# Altium schematic sheet micro_sd.SchDoc
size A3; SheetNumber: 12; SheetTotal: 15
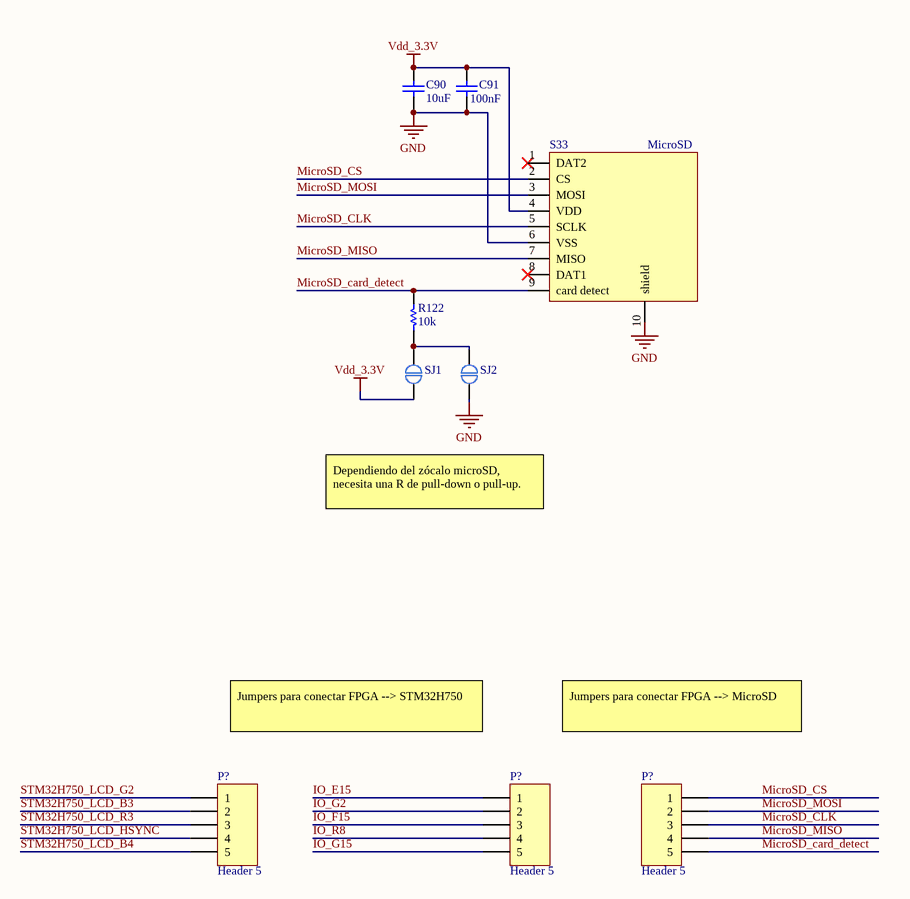
[diagram p0: micro_sd.SchDoc]

## Parts
(Parts that share a designator on the sheet are numbered #1, #2 ... from top to bottom, then left to right.)
C90  value 10uF  [capacitor 0603]  (hidden comment: ceramic capacitor)
C91  value 100nF  [capacitor 0603]  (hidden comment: Ceramic capacitor)
P?#1  Header 5  [HDR1X5]
P?#2  Header 5  [HDR1X5]
P?#3  Header 5  [HDR1X5]
R122  value 10k  [resistor 0603]  (hidden comment: resistor)
S33  MicroSD  [Micro sd]
SJ1  Solder jumper NO  [normally open solder jumper]  (value not drawn)
SJ2  Solder jumper NO  [normally open solder jumper]  (value not drawn)

## Nets
GND: C90.1 C91.1 S33.6(VSS) S33.10(shield) SJ2.1
Vdd_3.3V: C90.2 C91.2 S33.4(VDD) SJ1.1
IO_E15: P?#2.1
IO_F15: P?#2.3
IO_G2: P?#2.2
IO_G15: P?#2.5
IO_R8: P?#2.4
MicroSD_card_detect: P?#3.5 R122.1 S33.9(card_detect)
MicroSD_CLK: P?#3.3 S33.5(SCLK)
MicroSD_CS: P?#3.1 S33.2(CS)
MicroSD_MISO: P?#3.4 S33.7(MISO)
MicroSD_MOSI: P?#3.2 S33.3(MOSI)
STM32H750_LCD_B3: P?#1.2
STM32H750_LCD_B4: P?#1.5
STM32H750_LCD_G2: P?#1.1
STM32H750_LCD_HSYNC: P?#1.4
STM32H750_LCD_R3: P?#1.3
NetR122_2: R122.2 SJ1.2 SJ2.2

Not connected (* = marked no-connect by the designer): S33 1(DAT2)* 8(DAT1)*

## Notes on the sheet
- Dependiendo del zócalo microSD, necesita una R de pull-down o pull-up.
- Jumpers para conectar FPGA --> STM32H750
- Jumpers para conectar FPGA --> MicroSD

## Library data of the parts
C90 = ceramic capacitor: Multilayer ceramic capacitor; V: 6.3; LCSC part: C1691; Package: 0603
C91 = Ceramic capacitor: Multilayer ceramic capacitor; V: 50; LCSC part: C14663; Package: 0603
P?#1-P?#3 = Header 5: Header, 5-Pin; LatestRevisionDate: 17-Jul-2002; LatestRevisionNote: Re-released for DXP Platform.; Publisher: Altium Limited
S33 = Micro SD: Micro SD memory
SJ1 SJ2 = Solder jumper NO: Normally open solder jumper
R122 = resistor: Package: 0603